# EAGLE design OG19AWv2_main (EAGLE 9.3.2)
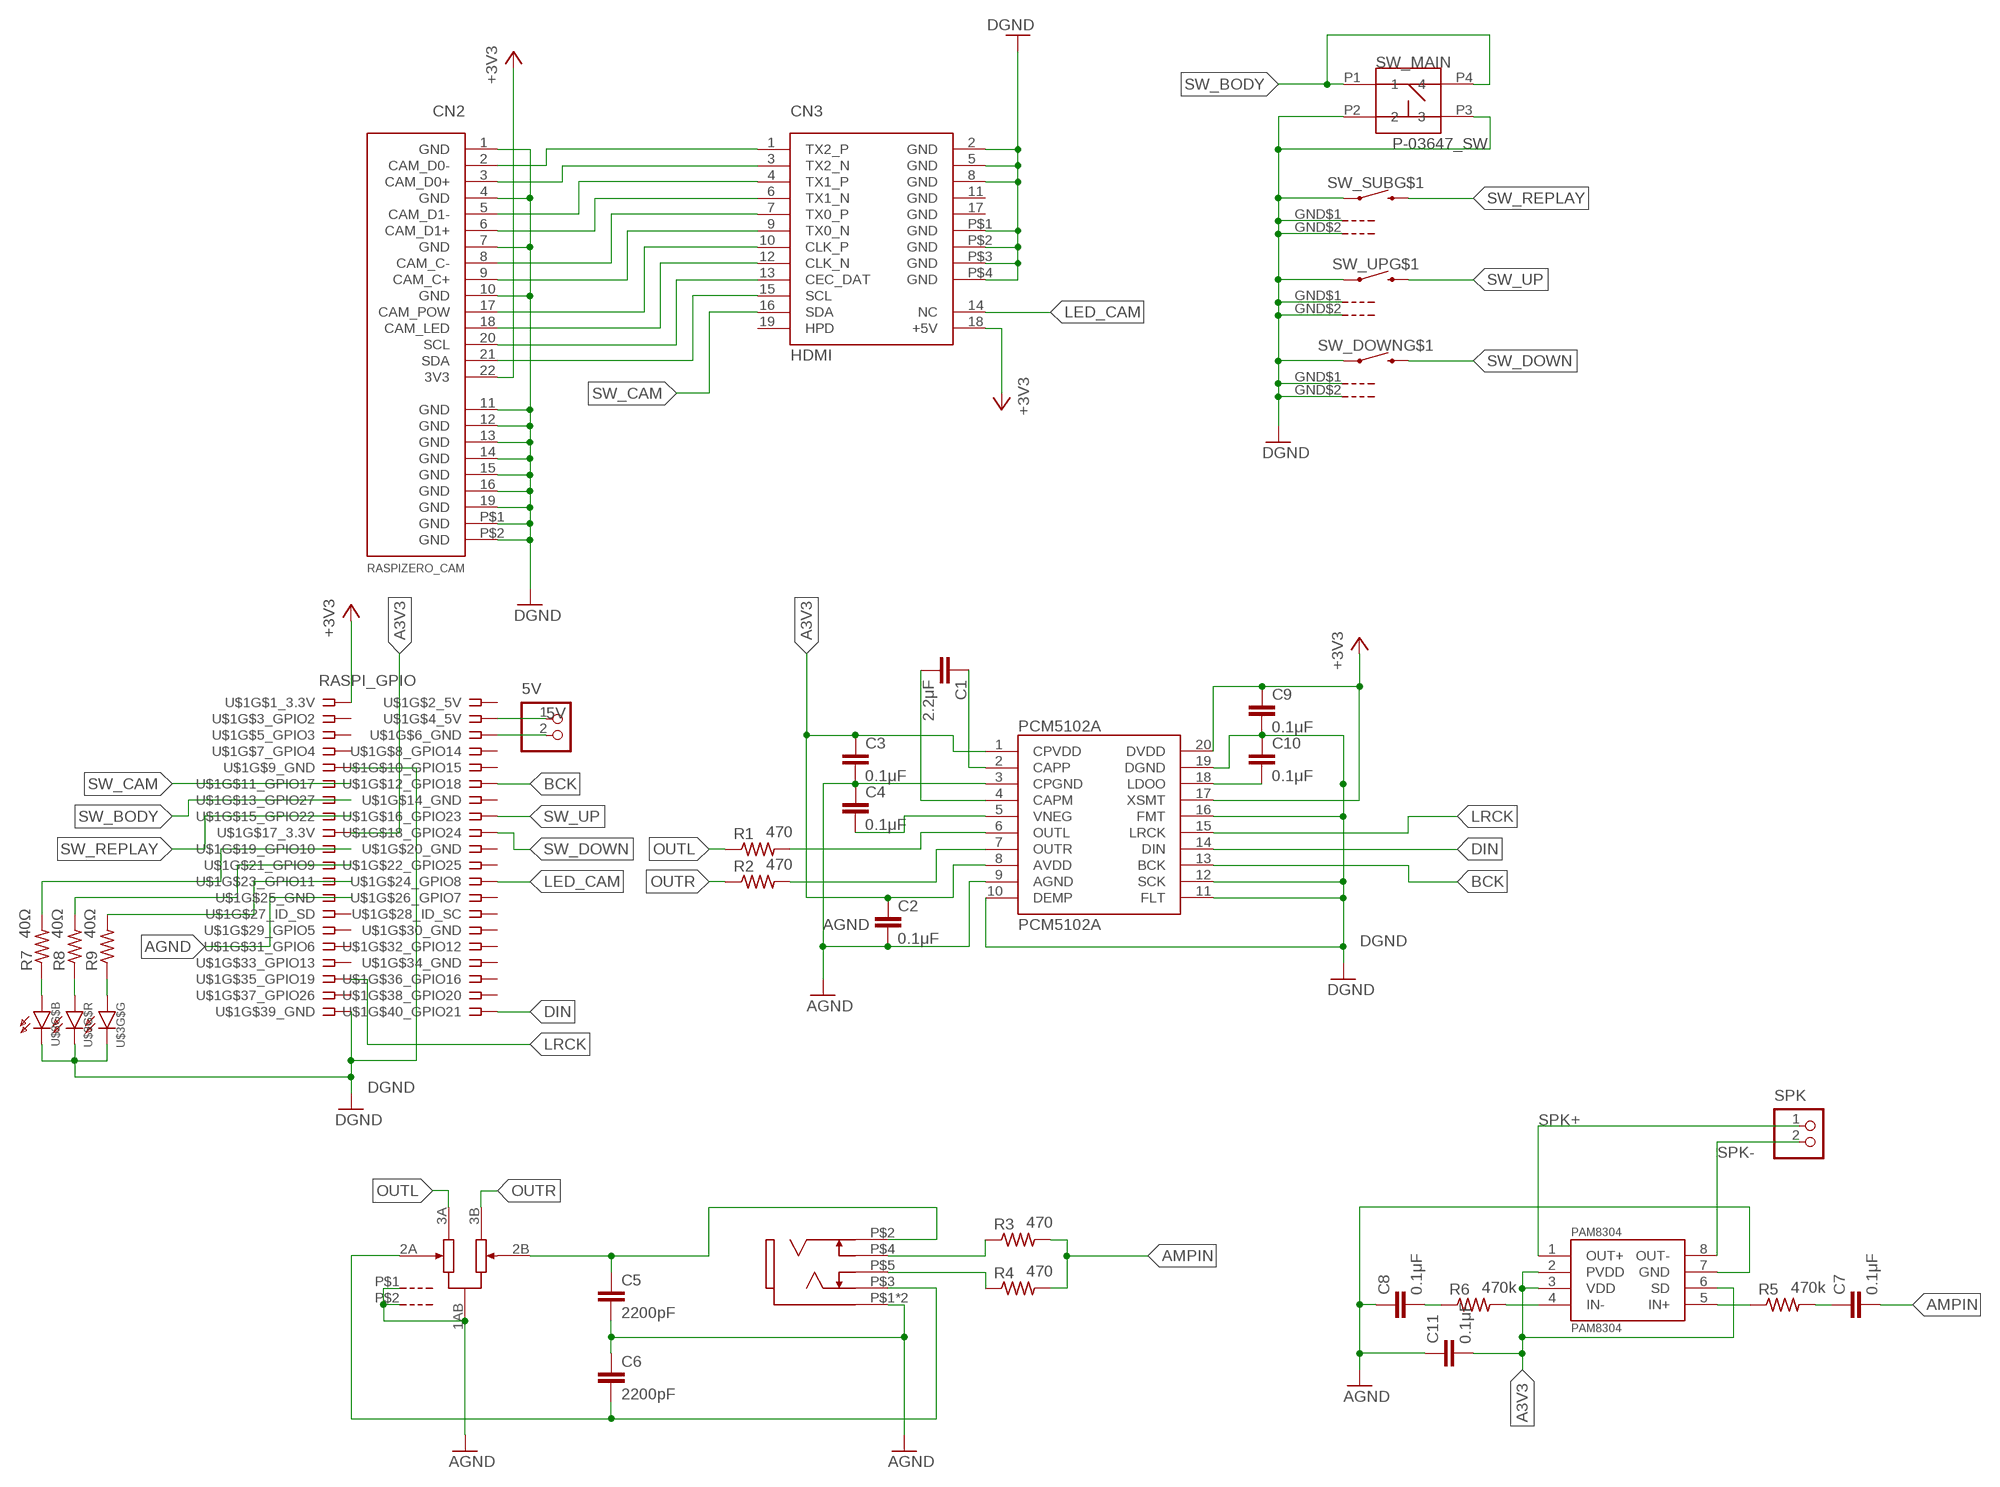
[diagram p0: schematic, sheet 1]

## Parts
5V  S2B-XH-A  [B2B-XH-A]
C1  2.2μF  C-EUC0603  [C0603]
C2  0.1μF  C-EUC0603  [C0603]
C3  0.1μF  C-EUC0603  [C0603]
C4  0.1μF  C-EUC0603  [C0603]
C5  2200pF  C-EUC0603  [C0603]
C6  2200pF  C-EUC0603  [C0603]
C7  0.1μF  C-EUC0603  [C0603]
C8  0.1μF  C-EUC0603  [C0603]
C9  0.1μF  C-EUC0603  [C0603]
C10  0.1μF  C-EUC0603  [C0603]
C11  0.1μF  C-EUC0603  [C0603]
CN1  SWICHCRAFT_3.5MM_PHONE_JACK  [SJ-43516-SMT]
CN2  RASPIZERO_CAM  [FH12-22S-0.5SH]
CN3  HDMI  [HDMI]
PAM8304  PAM8304  [MSOP8]
PCM5102A  PCM5102A  [SSOP20]
R1  470  R-US_R0603  [R0603]
R2  470  R-US_R0603  [R0603]
R3  470  R-US_R0603  [R0603]
R4  470  R-US_R0603  [R0603]
R5  470k  R-US_R0603  [R0603]
R6  470k  R-US_R0603  [R0603]
R7  40Ω  R-US_R0603  [R0603]
R8  40Ω  R-US_R0603  [R0603]
R9  40Ω  R-US_R0603  [R0603]
SPK  S2B-XH-A  [B2B-XH-A]
SW_DOWN  ALPS_SKHH_TACT_SWITCH  [SKHH_SIDEPUSH]
SW_MAIN  P-03647_SW  [SW]
SW_SUB  ALPS_SKHH_TACT_SWITCH  [SKHH_SIDEPUSH]
SW_UP  ALPS_SKHH_TACT_SWITCH  [SKHH_SIDEPUSH]
U$1  RASPI_GPIO  [SSW-120-02-G-D]
U$3  KPF-3236SURKMGKPBC  [S6-3528RGBTA]
VR1  ALPS_RK10J  [RK10J_DIP]

## Nets
5V: 5V.1 U$1.4
+3V3: C9.1 CN2.22(3V3) CN3.18(+5V) PCM5102A.17(XSMT) PCM5102A.20(DVDD) U$1.1
A3V3: C2.1 C3.1 C11.2 PAM8304.2(PVDD) PAM8304.3(VDD) PAM8304.6(SD) PCM5102A.1(CPVDD) PCM5102A.8(AVDD) U$1.17
AGND: C2.2 C3.2 C4.1 C5.2 C6.1 C8.1 C11.1 CN1.P$1 CN1.P$6 PAM8304.7(GND) PCM5102A.3(CPGND) PCM5102A.9(AGND) U$1.25 VR1.1AB VR1.P$1(G) VR1.P$2(G)
AMPIN: C7.2 R3.2 R4.2
BCK: PCM5102A.13(BCK) U$1.12
DGND: C9.2 C10.1 CN2.1(GND) CN2.4(GND) CN2.7(GND) CN2.10(GND) CN2.11(GND) CN2.12(GND) CN2.13(GND) CN2.14(GND) CN2.15(GND) CN2.16(GND) CN2.19(GND) CN2.P$1(GND) CN2.P$2(GND) CN3.2(GND) CN3.5(GND) CN3.8(GND) CN3.P$1(GND) CN3.P$2(GND) CN3.P$3(GND) CN3.P$4(GND) PCM5102A.10(DEMP) PCM5102A.11(FLT) PCM5102A.12(SCK) PCM5102A.16(FMT) PCM5102A.19(DGND) SW_DOWN.GND$1(G) SW_DOWN.GND$2(G) SW_DOWN.P$1 SW_MAIN.P2 SW_MAIN.P3 SW_SUB.GND$1(G) SW_SUB.GND$2(G) SW_SUB.P$1 SW_UP.GND$1(G) SW_UP.GND$2(G) SW_UP.P$1 U$1.9 U$1.39 U$3.P$1(G$B:K) U$3.P$2(G$R:K) U$3.P$3(G$G:K)
DIN: PCM5102A.14(DIN) U$1.40
LED_CAM: CN3.14(NC) U$1.24
LRCK: PCM5102A.15(LRCK) U$1.35
N$1: C5.1 CN1.P$2 VR1.2B
N$2: C6.2 CN1.P$3 VR1.2A
N$3: CN1.P$4 R3.1
N$4: C1.1 PCM5102A.2(CAPP)
N$5: C10.2 PCM5102A.18(LDOO)
N$6: C1.2 PCM5102A.4(CAPM)
N$7: C4.2 PCM5102A.5(VNEG)
N$8: CN1.P$5 R4.1
N$9: PAM8304.5(IN+) R5.1
N$10: C7.1 R5.2
N$11: PAM8304.4(IN-) R6.2
N$12: CN2.2(CAM_D0-) CN3.1(TX2_P)
N$13: C8.2 R6.1
N$14: CN2.3(CAM_D0+) CN3.3(TX2_N)
N$15: CN2.5(CAM_D1-) CN3.4(TX1_P)
N$16: CN2.6(CAM_D1+) CN3.6(TX1_N)
N$17: CN2.8(CAM_C-) CN3.7(TX0_P)
N$18: CN2.9(CAM_C+) CN3.9(TX0_N)
N$19: CN2.17(CAM_POW) CN3.10(CLK_P)
N$20: CN2.18(CAM_LED) CN3.12(CLK_N)
N$21: CN2.20(SCL) CN3.13(CEC_DAT)
N$22: CN2.21(SDA) CN3.15(SCL)
N$23: R7.1 U$3.P$4(G$B:A)
N$24: 5V.2 U$1.6
N$25: R7.2 U$1.19
N$26: R8.2 U$1.21
N$27: R9.2 U$1.23
N$28: R8.1 U$3.P$5(G$R:A)
N$29: R9.1 U$3.P$6(G$G:A)
OUTL: R1.1 VR1.3A
OUTL1: PCM5102A.6(OUTL) R1.2
OUTR: R2.1 VR1.3B
OUTR1: PCM5102A.7(OUTR) R2.2
SPK+: PAM8304.1(OUT+) SPK.1
SPK-: PAM8304.8(OUT-) SPK.2
SW_BODY: SW_MAIN.P1 SW_MAIN.P4 U$1.13
SW_CAM: CN3.16(SDA) U$1.11
SW_DOWN: SW_DOWN.P$2 U$1.18
SW_REPLAY: SW_SUB.P$2 U$1.15
SW_UP: SW_UP.P$2 U$1.16
Unconnected: CN3.11(GND) CN3.17(GND) CN3.19(HPD) U$1.2 U$1.3 U$1.5 U$1.7 U$1.8 U$1.10 U$1.14 U$1.20 U$1.22 U$1.26 U$1.27 U$1.28 U$1.29 U$1.30 U$1.31 U$1.32 U$1.33 U$1.34 U$1.36 U$1.37 U$1.38

## Library data of the parts
5V SPK = jst-xh:S2B-XH-A: Wire-to-Board 2.5mm pitch side mount connector Source: http://www.jst-mfg.com/product/pdf/jpn/XH.pdf http://www.jst-mfg.com/product/detail.php?series=277; LCSC: C158012
C1 = rcl:C-EU: CAPACITOR, European symbol; LCSC: C23630; SPICEPREFIX: C
C2-C4 C7-C11 = rcl:C-EU: CAPACITOR, European symbol; LCSC: C14663; SPICEPREFIX: C
C5 C6 = rcl:C-EU: CAPACITOR, European symbol; LCSC: C1604; SPICEPREFIX: C
CN1 = raspberry_pi_lib:SWICHCRAFT_3.5MM_PHONE_JACK; LCSC: C4992780
CN2 = raspberry_pi_lib:RASPIZERO_CAM: https://jp.rs-online.com/web/p/fpc-connectors/7727049/; LCSC: C597981
CN3 = raspberrypi_cm:HDMI; LCSC: C427307
PAM8304 = raspberry_pi_lib:PAM8304; LCSC: C581342
PCM5102A = raspberry_pi_lib:PCM5102A; LCSC: C107671
R1-R4 = rcl:R-US_: RESISTOR, American symbol; LCSC: C23179; SPICEPREFIX: R
R5 R6 = rcl:R-US_: RESISTOR, American symbol; LCSC: C23178; SPICEPREFIX: R
R7-R9 = rcl:R-US_: RESISTOR, American symbol; LCSC: C23047; SPICEPREFIX: R
SW_DOWN SW_SUB SW_UP = raspberry_pi_lib:ALPS_SKHH_TACT_SWITCH; MPN: Alps SKHHLPA010; SUPPLIER: Akizuki 107193
SW_MAIN = Akizuki:P-03647_SW; MPN: Cosland TS-0606-F-N-RED; SUPPLIER: Akizuki P-03646
U$1 = raspberry_pi_lib:RASPI_GPIO; LCSC: C5124634
U$3 = Akizuki:KPF-3236SURKMGKPBC; LCSC: C2843672
VR1 = raspberry_pi_lib:ALPS_RK10J; MPN: R1001G16T2B-B10K; SUPPLIER: aitendo

## Board
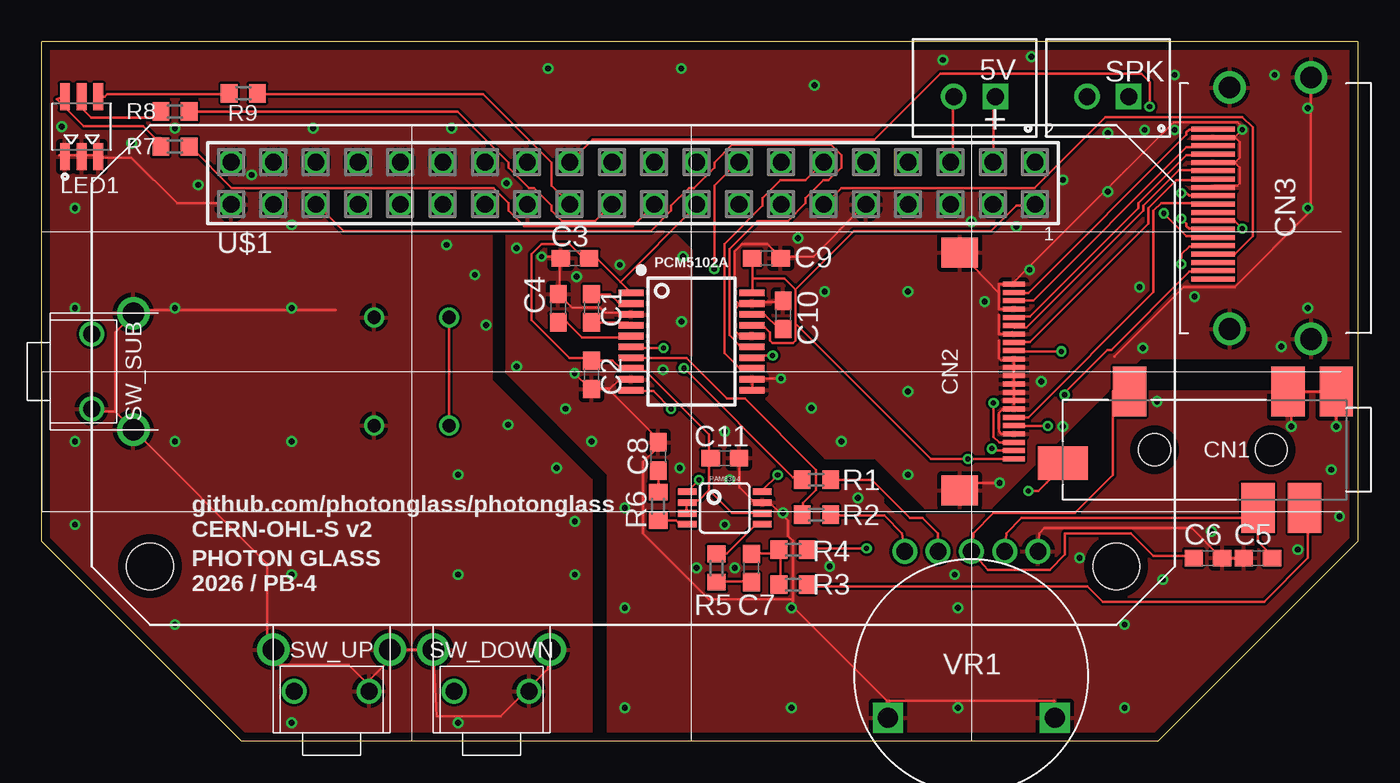
[diagram p1: board, top side]
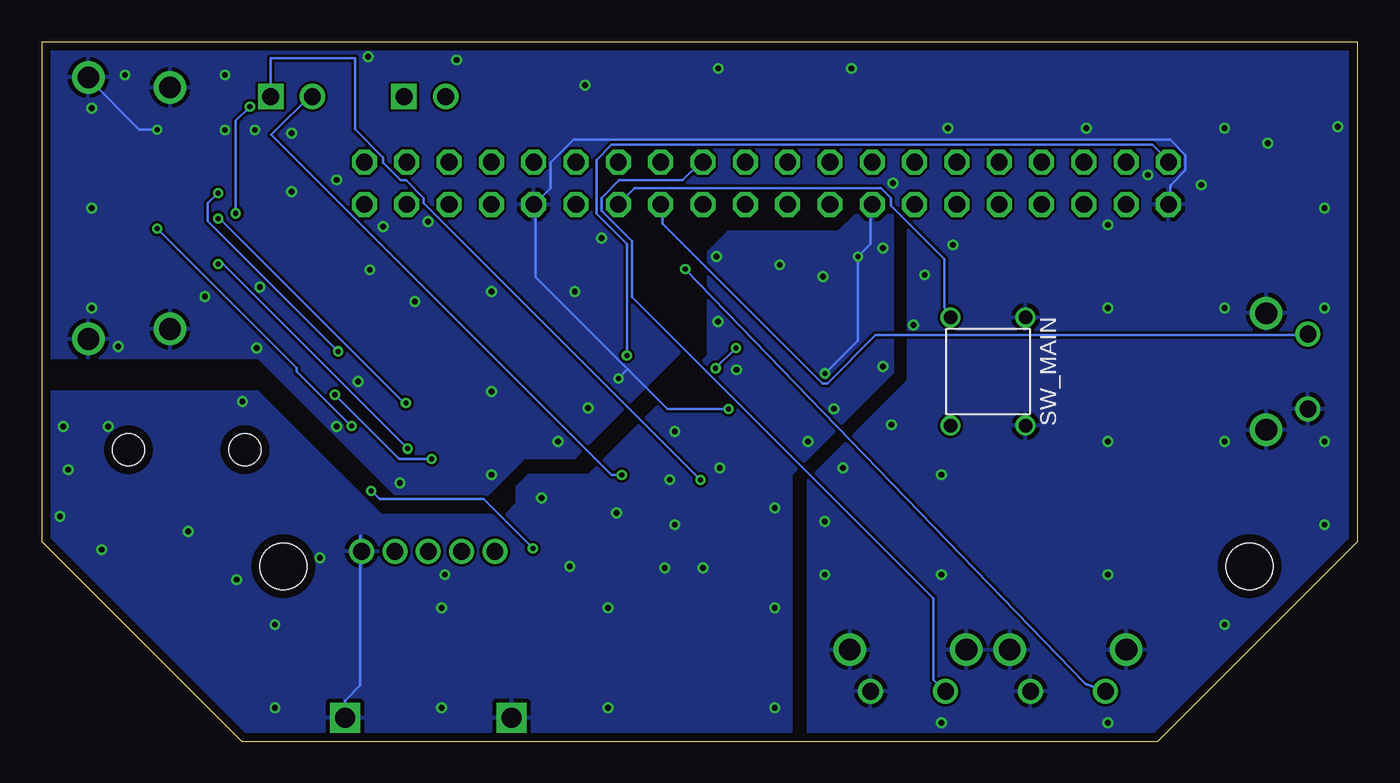
[diagram p2: board, bottom side, seen from below]

Size 79 x 42 mm. Coordinates in mm from the lower left corner, seen from the top.
Outline: 79,42 0,42 0,12 12,0 67,0 79,12 79,42
Copper layers (1*16): Top 0.035mm / dielectric 1.6mm / Bottom 0.035mm
Design rules "Elecrow_2-layer_PCB_eagle_rule": minimum track width 6mil, minimum drill 12mil, track to track 6mil, track to pad 6mil, pad to pad 6mil, via to via 8mil, smd to smd 0mil, copper to edge 20mil, drill to drill 10mil, minimum pad ring 6mil, minimum via ring 6mil, stop-mask expansion 0mil, vias tented up to drill 100mil, thermal gap 10mil
Holes 2.8 mm at 6.5,10.5 64.5,10.5

### Footprints (pad centres in the part's own frame; a part is rotated, then mirrored left to right if it is on the bottom)
B2B-XH-A = drill 1.016 square: 1 1.25,0 | drill 1.016: 2 -1.25,0
C0603 = smd 1.1 x 1: 1 -0.85,0; 2 0.85,0
SJ-43516-SMT = smd 2 x 3: P$1 0.6,-3.5; P$2 5.3,3.5; P$3 13,-3.5; P$4 2.5,3.5; P$6 3.5,-3.5 | smd 3 x 2: P$5 17,0.8 | hole 1.9: 4.5,0; 11.5,0
FH12-22S-0.5SH = smd 0.3 x 1.3: 1 -5.25,4.35; 2 -4.75,4.35; 3 -4.25,4.35; 4 -3.75,4.35; 5 -3.25,4.35; 6 -2.75,4.35; 7 -2.25,4.35; 8 -1.75,4.35; 9 -1.25,4.35; 10 -0.75,4.35; 11 -0.25,4.35; 12 0.25,4.35; 13 0.75,4.35; 14 1.25,4.35; 15 1.75,4.35; 16 2.25,4.35; 17 2.75,4.35; 18 3.25,4.35; 19 3.75,4.35; 20 4.25,4.35; 21 4.75,4.35; 22 5.25,4.35 | smd 1.8 x 2.2: P$1 7.15,1.1; P$2 -7.15,1.1
HDMI = smd 0.3 x 2.6: 1 4.75,4; 2 4.25,4; 3 3.75,4; 4 3.25,4; 5 2.75,4; 6 2.25,4; 7 1.75,4; 8 1.25,4; 9 0.75,4; 10 0.25,4; 11 -0.25,4; 12 -0.75,4; 13 -1.25,4; 14 -1.75,4; 15 -2.25,4; 16 -2.75,4; 17 -3.25,4; 18 -3.75,4; 19 -4.25,4 | drill 1.3: P$1 7.25,3; P$2 -7.25,3; P$3 -7.85,-1.9; P$4 7.85,-1.9
MSOP8 = smd 0.4 x 1.1: 1 -0.975,-2.25; 2 -0.325,-2.25; 3 0.325,-2.25; 4 0.975,-2.25; 5 0.975,2.25; 6 0.325,2.25; 7 -0.325,2.25; 8 -0.975,2.25
SSOP20 = smd 0.4 x 1.5: 1 -2.925,-3.625; 2 -2.275,-3.625; 3 -1.625,-3.625; 4 -0.975,-3.625; 5 -0.325,-3.625; 6 0.325,-3.625; 7 0.975,-3.625; 8 1.625,-3.625; 9 2.275,-3.625; 10 2.925,-3.625; 11 2.925,3.625; 12 2.275,3.625; 13 1.625,3.625; 14 0.975,3.625; 15 0.325,3.625; 16 -0.325,3.625; 17 -0.975,3.625; 18 -1.625,3.625; 19 -2.275,3.625; 20 -2.925,3.625
R0603 = smd 1 x 1.1: 1 -0.85,0; 2 0.85,0
SKHH_SIDEPUSH = drill 1.3: GND$1 3.5,2.5; GND$2 -3.5,2.5 | drill 1: P$1 2.25,0; P$2 -2.25,0
SW = drill 0.8: P1 -3.25,2.25; P2 -3.25,-2.25; P3 3.25,-2.25; P4 3.25,2.25
SSW-120-02-G-D = drill 1 pad 1.5 octagon: 1 -24.13,-1.27; 2 -24.13,1.27; 3 -21.59,-1.27; 4 -21.59,1.27; 5 -19.05,-1.27; 6 -19.05,1.27; 7 -16.51,-1.27; 8 -16.51,1.27; 9 -13.97,-1.27; 10 -13.97,1.27; 11 -11.43,-1.27; 12 -11.43,1.27; 13 -8.89,-1.27; 14 -8.89,1.27; 15 -6.35,-1.27; 16 -6.35,1.27; 17 -3.81,-1.27; 18 -3.81,1.27; 19 -1.27,-1.27; 20 -1.27,1.27; 21 1.27,-1.27; 22 1.27,1.27; 23 3.81,-1.27; 24 3.81,1.27; 25 6.35,-1.27; 26 6.35,1.27; 27 8.89,-1.27; 28 8.89,1.27; 29 11.43,-1.27; 30 11.43,1.27; 31 13.97,-1.27; 32 13.97,1.27; 33 16.51,-1.27; 34 16.51,1.27; 35 19.05,-1.27; 36 19.05,1.27; 37 21.59,-1.27; 38 21.59,1.27; 39 24.13,-1.27; 40 24.13,1.27
S6-3528RGBTA = smd 1.6 x 0.6: P$1 -1.8,1; P$2 -1.8,0; P$3 -1.8,-1; P$4 1.8,1; P$5 1.8,0; P$6 1.8,-1
RK10J_DIP = drill 1: 1AB -4,-7.5; 2A 0,-7.5; 2B -2,-7.5; 3A 2,-7.5; 3B 4,-7.5 | drill 1.2 square: P$1 5,2.5; P$2 -5,2.5

### Placement (x,y rotation side)
5V  56,38.7 0 top
C1  33,26 270 top
C2  33,22 270 top
C3  32,29 180 top
C4  31,26 270 top
C5  73,11 180 top
C6  70,11 180 top
C7  42.6,10.4 90 top
C8  37,17.1 270 top
C9  43.5,29 0 top
C10  44.5,25.6 270 top
C11  41,17 180 top
CN1  78.3,17.5 180 top
CN2  54,22.2 270 top
CN3  74.3,32 90 top
PAM8304  41,14 270 top
PCM5102A  39,24 270 top
R1  46.5,15.7 180 top
R2  46.5,13.6 180 top
R3  45.1,9.4 180 top
R4  45.1,11.5 180 top
R5  40.5,10.4 270 top
R6  37,14.1 270 top
R7  8,35.7 0 top
R8  8,37.8 0 top
R9  12.1,38.9 0 top
SPK  64,38.7 0 top
SW_DOWN  27,3 0 top
SW_MAIN  22.2,22.2 90 bottom
SW_SUB  3,22.2 270 top
SW_UP  17.4,3 0 top
U$1  35.5,33.5 0 bottom
U$3  2.4,36.9 90 top
VR1  55.8,3.9 180 top

### Tracks (layer width: path | path; a pad name or v marks a point on that pad's centre or on a via)
5V
  Top 0.152: U$1.4 57.14,34.89 57.14,37.78 5V.1
+3V3  (via drill 0.3)
  Top 0.152: CN2.22 53.65,16.95 53.37,16.94 45.25,25.07 | CN3.18 70.24,28.18 68.87,28.18 64.19,23.5 63.95,23.5 61.4,20.95 v61.4,20.8 | 42.66,27.77 42.66,26.96 PCM5102A.20 | 42.66,27.77 42.66,28.95 C9.1 | 45.25,27.12 45.25,25.07 | 45.25,25.07 45.25,24.07 45.1,23.92 43.88,23.92 43.72,24.07 43.72,24.53 43.42,24.83 42.66,24.83 PCM5102A.17 | 45.25,27.12 44.6,27.77 42.66,27.77 | 45.25,27.12 48.75,30.62 56.98,30.62 58.51,32.15 59.57,32.15 U$1.1
  Bottom 0.152: v55.6,16.95 57.55,16.95 v61.4,20.8
A3V3
  Top 0.152: 34.73,27.57 35.34,26.96 PCM5102A.1 | 34.73,27.57 33.36,28.95 32.9,28.95 C3.1 32.75,29.1 32.45,29.1 31.68,29.86 30.01,29.86 29.4,29.25 29.4,25.29 31.68,23 32.9,23 C2.1 33.06,22.85 34.28,22.85 34.73,22.39 35.34,22.39 PCM5102A.8 35.49,22.24 36.26,22.24 40.07,18.43 40.07,17.06 C11.2 40.07,16.91 40.07,15.08 | 34.73,27.57 39.3,32.15 U$1.17 | PAM8304.3 38.7,13.71 38.7,14.32 PAM8304.2 38.85,14.47 39.46,14.47 40.07,15.08 | 40.07,15.08 41.44,13.71 43.12,13.71 PAM8304.6
AGND  (via drill 0.3, 0.35)
  Top 0.152: C5.2 72.07,10.96 70.85,10.96 C6.1 70.7,11.12 69.02,12.79 60.18,12.79 59.88,12.49 VR1.1AB | PCM5102A.3 35.34,25.75 33.82,25.75 33.51,26.05 31.84,26.05 31.07,26.81 C4.1 31.07,26.96 31.07,28.95 C3.2 31.07,29.1 v30.01,29.1 | 33.97,21.17 34.12,21.17 34.58,21.63 35.34,21.63 PCM5102A.9 | 33.97,21.17 33.06,21.17 C2.2 32.9,21.17 v31.99,22.09 | 33.97,21.17 36.87,18.28 36.87,17.97 C8.1 36.87,17.82 36.87,17.52 36.1,16.75 36.1,12.49 40.07,8.52 45.1,8.52 | C11.1 41.9,16.91 41.9,15.23 42.66,14.47 43.12,14.47 PAM8304.7 43.27,14.32 43.72,14.32 44.79,13.25 44.79,12.33 45.1,12.03 45.1,8.52 | 45.1,8.52 45.1,8.07 50.73,2.43 VR1.P$1 50.89,2.43 60.79,2.43 VR1.P$2 | CN1.P$6 CN1.P$1 | v75,18.9 75,19.6 | v77.7,18.9 77.7,19.6
  Bottom 0.152: U$1.25 29.25,32.15 29.25,29.86 v30.01,29.1 30.01,24.07 v31.99,22.09 | VR1.1AB 59.88,12.33 59.88,3.34 60.79,2.43 VR1.P$2
  other vias: 28.5,22.5 33,18 37.3,22.3 41,18.6 38.3,16.4 35,14 41.3,15.7 44.5,13.7 35,8 35,2 39.3,10.4 41.6,10.4 65,2 55,2 45,2 45,8 47.3,10.5 49,14.6 41,13 54.8,10 62.3,11 67.3,9.7 65,7 55,8 70.2,12.6 77.4,16.3 75.4,11.5 77.9,13.5 28.5,29.6 32.1,27.9 34.7,28.6 38.5,29.1 38.4,25.2 31.45,19.96 66.95,20.39
  pour Top: 27.9,31.6 30.1,31.6 31.1,30.6 37.9,30.6 39,29.5 39,23.1 46.1,16 49.8,16 50.5,15.3 50.5,14.3 51.2,13.6 58.5,13.6 65.9,21 79,21 79,12 67,0 34,0 34,16 27.9,22.1
  pour Bottom: 34,0 67,0 79,12 79,21 66,21 58.6,13.6 51.2,13.6 50.5,14.3 50.5,15.3 49.8,16 46.2,16 39,23.2 39,29.4 37.8,30.6 31.2,30.6 30.2,31.6 27.9,31.6 27.9,22.1 34,16
AMPIN
  Top 0.152: 44.33,11.27 44.33,11.42 R4.2 44.33,11.27 | 44.33,11.27 44.33,9.44 R3.2 | 44.33,11.27 42.66,11.27 C7.2
BCK
  Top 0.152: PCM5102A.13 42.51,22.39 41.9,22.39 40.98,23.31 40.98,29.86 43.27,32.15 43.27,32.6 44.33,33.67 45.86,33.67 46.92,34.74 U$1.12
DGND  (via drill 0.3, 0.35)
  Top 0.152: U$3.P$1 1.05,35.19 2.27,35.19 U$3.P$2 2.42,35.19 3.64,35.19 U$3.P$3 3.8,35.04 5.39,35.04 8.13,32.3 11.26,32.3 U$1.39 | C10.1 44.49,26.36 42.66,26.36 PCM5102A.19 | 41.9,26.2 41.59,25.9 41.59,24.68 41.9,24.37 42.51,24.37 PCM5102A.16 | 41.9,26.2 42.51,26.2 PCM5102A.19 | PCM5102A.11 42.66,21.17 42.66,21.63 PCM5102A.12 42.66,21.78 v44.38,21.78 | U$1.9 49.36,32.15 46.31,29.1 44.49,29.1 C9.2 44.33,29.1 43.57,29.86 42.05,29.86 41.59,29.4 41.59,26.51 41.9,26.2 | v37.78,19.95 36.71,21.02 35.49,21.02 PCM5102A.10 | 41.9,26.2 PCM5102A.19 | 29.55,3.51 29.55,3.04 SW_DOWN.P$1 | 29.55,3.51 30.35,4.31 SW_DOWN.GND$1 | 29.55,3.51 27.55,1.51 23.7,1.51 SW_DOWN.GND$2 20.73,5.5 20.71,5.58 | 19.49,3.51 19.49,3.04 SW_UP.P$1 | 19.49,3.51 20.9,4.92 SW_UP.GND$1 | 19.49,3.51 18.43,4.58 13.76,4.58 SW_UP.GND$2 13.55,5.63 13.55,10.66 5.62,18.58 SW_SUB.GND$1 5.47,18.73 4.41,19.8 | 4.41,19.8 3.03,19.8 SW_SUB.P$1 | 17.64,25.9 5.78,25.9 5.62,25.75 SW_SUB.GND$2 5.47,25.59 4.41,24.53 4.41,19.8 | CN2.19 57.61,18.45 57.62,18.45 57.44,18.63 57.44,19.7 57.69,19.95 CN2.16 58.36,20 | 58.36,20.87 58.36,21.37 CN2.13 58.36,21.53 58.36,21.63 | 58.36,21.07 CN2.14 58.36,20.92 58.36,20.26 | 58.36,21.83 CN2.12 58.36,21.98 | 58.36,22.7 58.36,22.59 CN2.11 58.36,21.78 | 58.36,22.9 CN2.10 58.2,22.85 57.59,22.85 57.44,23 57.44,24.07 | CN2.7 57.44,24.45 57.44,25.59 | CN2.4 57.44,25.95 57.44,26.9 | 57.44,26.9 57.44,27.45 CN2.1 | CN2.15 | 57.44,26.9 CN2.P$2 | 71.61,34.74 71.92,34.43 71.92,33.52 71.77,33.36 70.39,33.36 CN3.8 | 71.61,34.74 70.39,34.74 CN3.5 | 71.61,36.26 70.39,36.26 CN3.2 | 71.61,36.26 71.92,35.96 71.92,35.04 71.61,34.74
  Top 0.152: 71.61,36.26 71.92,36.57 71.92,36.72 | 71.92,36.72 71.92,37.02 71.77,37.17 67.96,37.17 58.36,27.57 | 64.39,23.1 68.57,27.27 71.61,27.27 76.19,31.84 76.19,39.77 CN3.P$4 | v72.07,36.72 71.92,36.72 | v57.5,15.5 55.55,15.5 CN2.P$1
  Bottom 0.152: v37.78,19.95 41.44,19.95 43.82,22.34 | 43.82,22.34 49.36,27.88 49.36,32.15 U$1.9 49.36,32.3 48.45,33.21 48.45,34.74 47.08,36.11 11.26,36.11 10.35,35.19 10.35,34.28 11.26,33.36 11.26,32.3 U$1.39 | 43.82,22.34 v44.38,21.78 | v72.07,36.72 73.14,36.72 76.19,39.77 CN3.P$4
  other vias: 52,27 52,16 45.4,30.2 56.6,26.4 52,21 48,18 46.2,20 60,21.6 65.9,27.27 64,33 68,36.7 66.2,36.7 59.3,28.3 55.8,31.2 58.5,30.9 61.3,33.7 64,36.5 47,27 24.6,36.8 16.3,36.8 8,36.8 1.2,36.9 5.4,35.9 9.4,33.4 2,32 2,26 2,18 2,13 8,18 15,18 8,7 15,10 15,1.1 25,1.1 25,10 32,10 32,13.2 30.9,16.4 28,19 25,16 26,28 24.3,29.8 15,31 15,26 8,26 66.1,23.6 74.4,23.7 69.2,26.7 76,26 76,32 76,38 74,40 68,40 59.4,41.1 54.1,40.9 12.6,34 27.9,33.5 61.3,18.9 26.68,24.98 38.39,40.39 46.39,39.39 30.39,40.39
  pour Top: 33,0 33,15.7 27,21.7 27,32 38,32 40,30 40,24 47,17 50,17 53,14 57,14 66,23 79,23 79,42 0,42 0,12 12,0
  pour Bottom: 33,0 12,0 0,12 0,42 79,42 79,23 66,23 57,14 53,14 50,17 47,17 40,24 40,30 38,32 27,32 27,21.7 33,15.7
DIN  (via drill 0.3)
  Top 0.152: v43.88,23.15 42.66,23.15 PCM5102A.14
  Bottom 0.152: v43.88,23.15 43.88,29.86 45.71,31.69 45.71,34.89 44.79,35.8 12.33,35.8 11.42,34.89 U$1.40
LED_CAM  (via drill 0.3)
  Top 0.152: v67.35,31.69 68.72,30.32 70.24,30.32 CN3.14 | U$1.24 31.84,34.89 33.06,36.11 49.97,36.11 53.94,40.07 59.12,40.07 66,40.07 66.5,39.57 v66.5,38.1
  Bottom 0.152: v67.35,31.69 67.35,36.87 67.35,37.25 v66.5,38.1
LRCK
  Top 0.152: PCM5102A.15 42.51,23.76 41.9,23.76 41.29,24.37 41.29,29.55 42.96,31.23 44.79,31.23 45.86,32.3 45.86,32.6 46.92,33.67 47.23,33.67 47.99,34.43 47.99,35.19 47.38,35.8 41.44,35.8 40.37,34.74 40.37,34.43 39.15,33.21 38.85,33.21 37.78,32.15 37.78,31.84 36.56,30.62 18.12,30.62 16.6,32.15 U$1.35
N$1
  Top 0.152: VR1.2B 57.9,12.49 58.81,13.4 72.98,13.4 72.98,12 73.85,11.13 C5.1
N$2
  Top 0.152: C6.2 69.02,11.12 66.74,11.12 65.36,12.49 61.4,12.49 61.4,11.2 60.5,10.3 56.8,10.3 VR1.2A | 55.92,12.33 VR1.2A | VR1.2A 55.92,12.49 57.14,13.71 62.01,13.71 64.3,15.99 64.3,16.91 64.3,21 CN1.P$3
N$3
  Top 0.152: R3.1 46.01,9.29 62.77,9.29 63.69,8.37 73.37,8.37 76,11 76,13 75.3,13
N$4
  Top 0.152: C1.1 33.06,26.81 34.12,26.81 34.58,26.36 35.34,26.36 PCM5102A.2
N$5
  Top 0.152: C10.2 44.49,24.83 44.18,24.83 43.42,25.59 42.66,25.59 PCM5102A.18
N$6
  Top 0.152: C1.2 33.06,25.14 35.19,25.14 35.34,24.98 PCM5102A.4
N$7
  Top 0.152: C4.2 31.07,25.14 31.53,25.14 32.45,24.22 35.34,24.22 PCM5102A.5
N$8  (via drill 0.3)
  Top 0.152: v49.52,11.57 46.01,11.57 R4.1 | 61.5,16.7 61.4,16.6 60.34,15.53 59.83,15.03 v59.23,15.03
  Bottom 0.152: v49.52,11.57 52.48,14.53 58.73,14.53 v59.23,15.03
N$9
  Top 0.152: R5.1 40.52,11.27 41.13,11.27 42.81,12.94 43.12,12.94 PAM8304.5
N$10
  Top 0.152: R5.2 40.52,9.59 42.51,9.59 C7.1
N$11
  Top 0.152: R6.2 37.02,13.25 38.09,13.25 38.24,13.1 38.7,13.1 PAM8304.4
N$12
  Top 0.152: CN2.2 58.35,26.91 59.22,26.91 68.72,36.41 68.72,36.57 68.87,36.72 70.24,36.72 CN3.1
N$13
  Top 0.152: R6.1 37.02,15.08 37.02,16.14 C8.2
N$14
  Top 0.152: CN2.3 59.52,26.45 68.72,35.65 70.24,35.65 CN3.3
N$15
  Top 0.152: CN2.5 58.39,25.49 59.32,25.49 65.82,31.99 65.82,32.3 68.72,35.19 70.24,35.19 CN3.4
N$16
  Top 0.152: CN2.6 58.36,24.83 59.12,24.83 66.13,31.84 66.13,32.15 68.26,34.28 70.24,34.28 CN3.6
N$17
  Top 0.152: CN2.8 58.36,23.96 59.32,23.96 66.43,31.08 66.43,31.99 68.11,33.67 70.24,33.67 CN3.7
N$18  (via drill 0.3)
  Top 0.152: v61.2,23.41 58.35,23.41 CN2.9 | v68.41,32.91 68.72,32.91 68.87,32.76 70.24,32.76 CN3.9
  Bottom 0.152: v61.2,23.41 69.02,31.23 69.02,32.3 v68.41,32.91
N$19
  Top 0.152: CN2.17 59.22,19.44 66.74,26.96 66.74,31.84 67.19,32.3 70.24,32.3 CN3.10
N$20  (via drill 0.3)
  Top 0.152: v72.07,30.77 71.61,31.23 70.39,31.23 CN3.12 | CN2.18 58.36,18.94 59.62,18.94 v60.4,18.94
  Bottom 0.152: v72.07,30.77 63.69,22.39 63.69,22.19 60.4,18.9 v60.4,18.94
N$21  (via drill 0.3)
  Top 0.152: v57.14,20.31 57.14,18.28 57.49,17.92 58.29,17.92 CN2.20 | v68.41,31.38 68.72,31.08 68.72,30.93 68.87,30.77 70.24,30.77 CN3.13
  Bottom 0.152: v68.41,31.38 68.31,31.38 57.24,20.31 v57.14,20.31
N$22  (via drill 0.3)
  Top 0.152: CN2.21 58.34,17.46 57.14,17.46 v57.04,17.56 | v68.41,28.64 68.41,29.25 68.87,29.71 70.24,29.71 CN3.15
  Bottom 0.152: v68.41,28.64 68.11,28.64 v57.04,17.56
N$23
  Top 0.152: R7.1 7.14,36.2 6.81,36.2 6.09,36.93 2.52,36.93 0.9,38.55 U$3.P$4
N$24
  Top 0.152: U$1.6 54.7,34.89 54.7,37.94 5V.2
N$25
  Top 0.152: R7.2 8.98,35.65 11.42,33.21 27.11,33.21 28.03,32.3 28.03,31.84 28.94,30.93 35.49,30.93 36.71,32.15 U$1.19
N$26
  Top 0.152: R8.2 8.98,37.78 24.98,37.78 28.03,34.74 28.03,34.43 29.25,33.21 29.55,33.21 30.62,32.15 30.62,31.84 31.23,31.23 33.21,31.23 34.12,32.15 U$1.21
N$27
  Top 0.152: R9.2 13.09,38.85 26.5,38.85 30.62,34.74 30.62,33.36 31.68,32.3 U$1.23
N$28
  Top 0.152: R8.1 7.11,37.43 2.99,37.43 2.37,38.05 2.4,38.07 U$3.P$5
N$29
  Top 0.152: R9.1 11.11,38.85 3.95,38.85 3.8,38.7 U$3.P$6
OUTL
  Top 0.152: R1.1 47.38,15.69 49.82,15.69 52.11,13.4 52.87,13.4 53.78,12.49 VR1.3A
OUTL1  (via drill 0.3)
  Top 0.152: v38.54,22.39 45.1,15.84 45.55,15.84 R1.2 | v37.32,23.61 35.49,23.61 PCM5102A.6
  Bottom 0.152: v37.32,23.61 v38.54,22.39
OUTR
  Top 0.152: R2.1 47.38,13.55 50.58,13.55 51.65,12.49 VR1.3B
OUTR1
  Top 0.152: R2.2 45.71,13.71 45.71,14.32 46.47,15.08 46.47,16.3 42.2,20.56 41.13,20.56 38.7,23 35.49,23 PCM5102A.7
SPK+  (via drill 0.3)
  Top 0.152: v39.46,15.69 38.85,15.08 PAM8304.1
  Bottom 0.152: v39.46,15.69 56.07,32.3 56.07,32.6 57.14,33.67 57.44,33.67 58.51,34.74 58.51,35.04 60.2,36.73 60.2,41 65.25,41 SPK.1
SPK-  (via drill 0.3)
  Top 0.152: v44.18,15.99 43.27,15.08 PAM8304.8
  Bottom 0.152: v44.18,15.99 44.79,15.99 65.21,36.41 62.75,38.88 SPK.2
SW_BODY
  Top 0.152: SW_MAIN.P4 SW_MAIN.P1
  Bottom 0.152: U$1.13 44.33,32.3 43.42,33.21 28.64,33.21 28.03,32.6 28.03,32.15 24.83,28.95 24.83,26.05 24.45,25.67 SW_MAIN.P4
SW_CAM
  Top 0.152: CN3.16 70.39,29.25 71.61,29.25 72.68,30.32 72.68,36.87 72.07,37.48 63.84,37.48 59.57,33.21 47.99,33.21 47.08,32.3 U$1.11
SW_DOWN
  Bottom 0.152: SW_DOWN.P$2 25.48,3.68 25.48,8.57 43.57,26.66 43.57,30.01 45.4,31.84 45.4,32.6 44.33,33.67 40.52,33.67 39.46,34.74 U$1.18
SW_REPLAY
  Bottom 0.152: SW_SUB.P$2 3.03,24.37 28.94,24.37 31.84,21.48 32.14,21.48 41.74,31.08 41.74,32.15 U$1.15
SW_UP  (via drill 0.3)
  Top 0.152: v40.37,28.34 40.37,33.36 41.74,34.74 U$1.16
  Bottom 0.152: v40.37,28.34 16.37,3.43 SW_UP.P$2

### Text on the board
tPlace: github.com/photonglass/photonglass / CERN-OHL-S v2 | PHOTON GLASS / 2026 / PB-4
tNames: + | LED1 | PAM8304